# EAGLE design c64-rx (EAGLE 7.7.0)
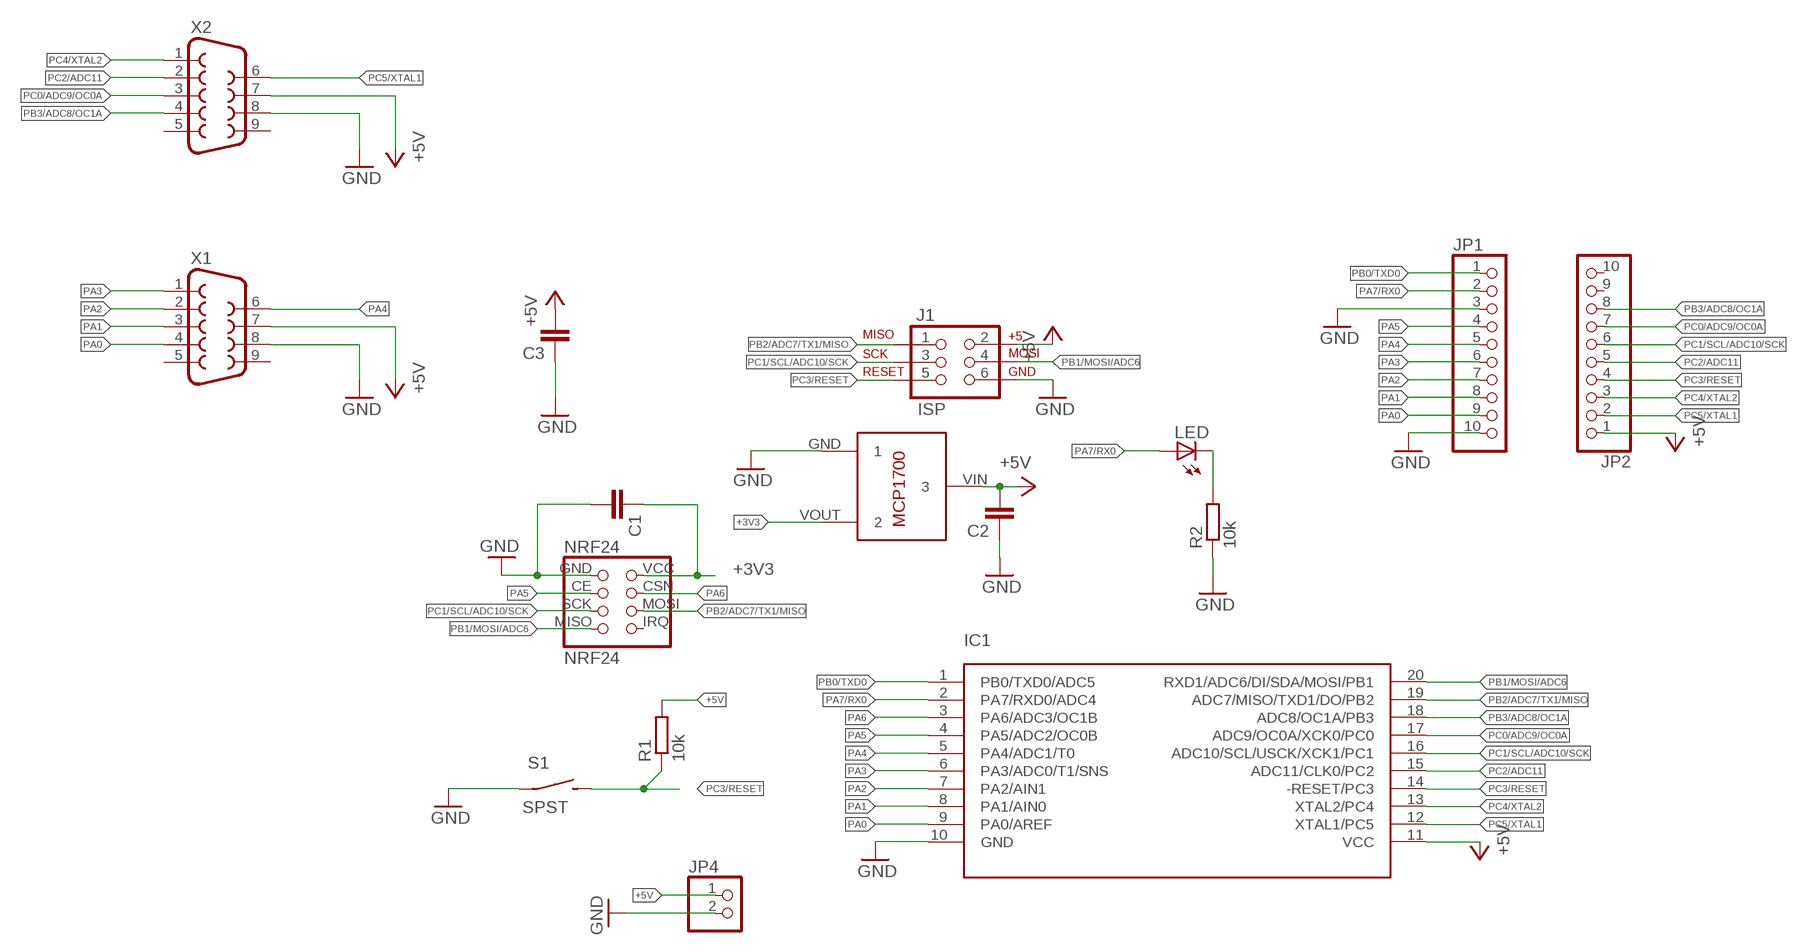
[diagram p0: schematic, sheet 1]

## Parts
C1  C-EUC1206K  [C1206K]
C2  C-EUC1206K  [C1206K]
C3  C-EUC1206K  [C1206K]
IC1  ATTINY1634  [SOIC20]
J1  ISP  AVR_SPI_PRG_6NS  [2X3-NS]
JP1  PINHD-1X10  [1X10]
JP2  PINHD-1X10  [1X10]
JP4  PINHD-1X2  [1X02]
LED  LEDSMT1206  [1206]
NRF24  NRF24  [NRF24]
R1  10k  R-EU_M1206  [M1206]
R2  10k  R-EU_M1206  [M1206]
S1  SPST  SPST_OFFBOARD_LG  [OFFBOARD_2_LG]
U$3  MCP1700T-3302E/TT  [MCP1700T-3302E/TT]
X1  F09D  [F09D]
X2  F09D  [F09D]

## Nets
+3V3 [POWER]: C1.1 NRF24.VCC U$3.VOUT
+5V [POWER]: C2.2 C3.2 IC1.11(VCC) J1.2 JP2.1 JP4.1 R1.2 U$3.VIN X1.7 X2.7
GND [POWER]: C1.2 C2.1 C3.1 IC1.10(GND) J1.6 JP1.3 JP1.10 JP4.2 NRF24.GND R2.1 S1.P$1(P) U$3.GND X1.8 X2.8
N$1: LED.C R2.2
PA0: IC1.9(PA0/AREF) JP1.9 X1.4
PA1: IC1.8(PA1/AIN0) JP1.8 X1.3
PA2: IC1.7(PA2/AIN1) JP1.7 X1.2
PA3: IC1.6(PA3/ADC0/T1/SNS) JP1.6 X1.1
PA4: IC1.5(PA4/ADC1/T0) JP1.5 X1.6
PA5: IC1.4(PA5/ADC2/OC0B) JP1.4 NRF24.CE
PA6: IC1.3(PA6/ADC3/OC1B) NRF24.CSN
PA7/RX0: IC1.2(PA7/RXD0/ADC4) JP1.2 LED.A
PB0/TXD0: IC1.1(PB0/TXD0/ADC5) JP1.1
PB1/MOSI/ADC6: IC1.20(RXD1/ADC6/DI/SDA/MOSI/PB1) J1.4 NRF24.MISO
PB2/ADC7/TX1/MISO: IC1.19(ADC7/MISO/TXD1/DO/PB2) J1.1 NRF24.MOSI
PB3/ADC8/OC1A: IC1.18(ADC8/OC1A/PB3) JP2.8 X2.4
PC0/ADC9/OC0A: IC1.17(ADC9/OC0A/XCK0/PC0) JP2.7 X2.3
PC1/SCL/ADC10/SCK: IC1.16(ADC10/SCL/USCK/XCK1/PC1) J1.3 JP2.6 NRF24.SCK
PC2/ADC11: IC1.15(ADC11/CLK0/PC2) JP2.5 X2.2
PC3/RESET: IC1.14(-RESET/PC3) J1.5 JP2.4 R1.1 S1.P$2(S)
PC4/XTAL2: IC1.13(XTAL2/PC4) JP2.3 X2.1
PC5/XTAL1: IC1.12(XTAL1/PC5) JP2.2 X2.6
Unconnected: JP2.9 JP2.10 NRF24.IRQ X1.5 X1.9 X2.5 X2.9

## Library data of the parts
C1 C2 = resistor:C-EU: CAPACITOR, European symbol
C3 = rcl:C-EU: CAPACITOR, European symbol
IC1 = attiny1634:ATTINY1634
J1 = SparkFun-Connectors:AVR_SPI_PRG_6: AVR ISP 6 Pin This is the reduced ISP connector for AVR programming. Common on Arduino. This footprint will take up less PCB space and can be used with a 10-pin to 6-pin adapter such as SKU: BOB-08508
JP1 JP2 = pinhead:PINHD-1X10: PIN HEADER
JP4 = pinhead:PINHD-1X2: PIN HEADER
LED = led:LED: LED OSRAM: - CHIPLED LG R971, LG N971, LY N971, LG Q971, LY Q971, LO R971, LY R971 LH N974, LH R974 LS Q976, LO Q976, LY Q976 LO Q996 - Hyper CHIPLED LW Q18S LB Q993, LB Q99A, LB R99A - SideLED LS A670, LO A670, LY A670, LG A670, LP A670 LB A673, LV A673, LT A673, LW A673 LH A674 LY A675 LS A676, LA A676, LO A676, LY A676, LW A676 LS A679, LY A679, LG A679 - Hyper Micro SIDELED® LS Y876, LA Y876, LO Y876, LY Y876 LT Y87S - SmartLED LW L88C, LW L88S LB L89C, LB L89S, LG L890 LS L89K, LO L89K, LY L89K LS L896, LA L896, LO L896, LY L896 - TOPLED LS T670, LO T670, LY T670, LG T670, LP T670 LSG T670, LSP T670, LSY T670, LOP T670, LYG T670 LG T671, LOG T671, LSG T671 LB T673, LV T673, LT T673, LW T673 LH T674 LS T676, LA T676, LO T676, LY T676, LB T676, LH T676, LSB T676, LW T676 LB T67C, LV T67C, LT T67C, LS T67K, LO T67K, LY T67K, LW E67C LS E67B, LA E67B, LO E67B, LY E67B, LB E67C, LV E67C, LT E67C LW T67C LS T679, LY T679, LG T679 LS T770, LO T770, LY T770, LG T770, LP T770 LB T773, LV T773, LT T773, LW T773 LH T774 LS E675, LA E675, LY E675, LS T675 LS T776, LA T776, LO T776, LY T776, LB T776 LHGB T686 LT T68C, LB T68C - Hyper Mini TOPLED® LB M676 - Mini TOPLED Santana® LG M470 LS M47K, LO M47K, LY M47K Source: http://www.osram.convergy.de LUXEON: - LUMILED® LXK2-PW12-R00, LXK2-PW12-S00, LXK2-PW14-U00, LXK2-PW14-V00 LXK2-PM12-R00, LXK2-PM12-S00, LXK2-PM14-U00 LXK2-PE12-Q00, LXK2-PE12-R00, LXK2-PE12-S00, LXK2-PE14-T00, LXK2-PE14-U00 LXK2-PB12-K00, LXK2-PB12-L00, LXK2-PB12-M00, LXK2-PB14-N00, LXK2-PB14-P00, LXK2-PB14-Q00 LXK2-PR12-L00, LXK2-PR12-M00, LXK2-PR14-Q00, LXK2-PR14-R00 LXK2-PD12-Q00, LXK2-PD12-R00, LXK2-PD12-S00 LXK2-PH12-R00, LXK2-PH12-S00 LXK2-PL12-P00, LXK2-PL12-Q00, LXK2-PL12-R00 Source: www.luxeon.com KINGBRIGHT: KA-3528ASYC Source: www.kingbright.com
NRF24 = mine:NRF24
R1 R2 = rcl:R-EU_: RESISTOR, European symbol
S1 = bt_electromech:SPST: SPST SWITCH
U$3 = MCP1700T-3302E_TT:MCP1700T-3302E/TT: Microchip LDO "MCP1700" in a 3-Pin SOT-23 package. ID: MCP1700T-3302E/TT
X1 X2 = con-subd:F09: SUB-D; OC_FARNELL: unknown; OC_NEWARK: unknown

## Net classes
1 POWER: width 0.254 mm

## Board
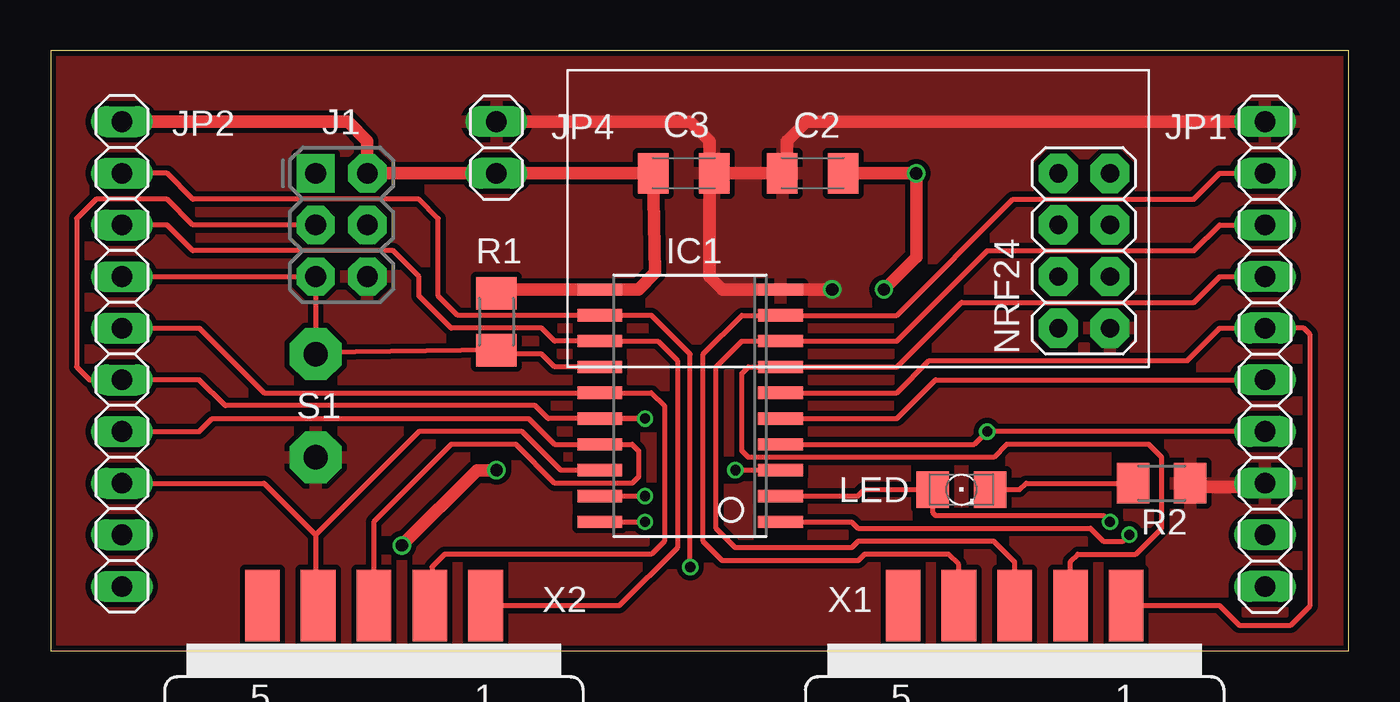
[diagram p1: board, top side]
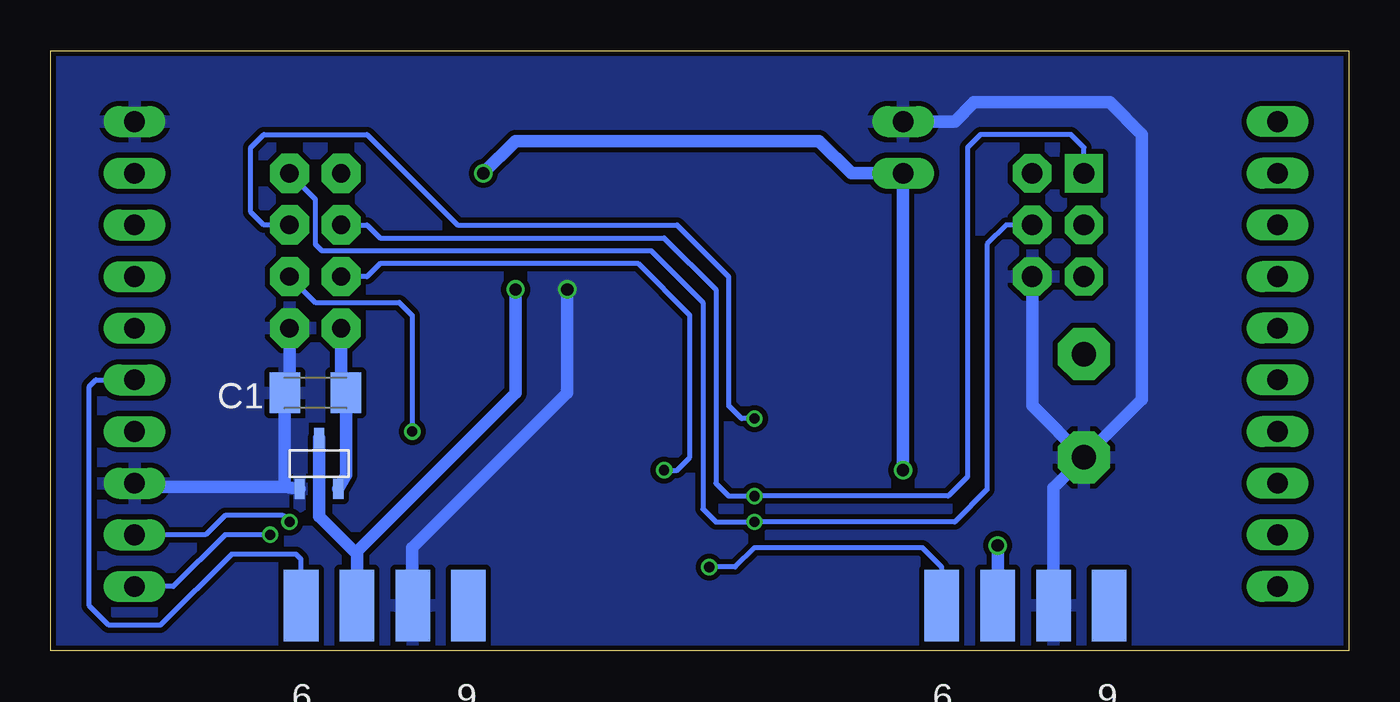
[diagram p2: board, bottom side, seen from below]

Size 63.8 x 29.52 mm. Coordinates in mm from the lower left corner, seen from the top.
Outline: 0,0 63.8,0 63.8,29.52 0,29.52 0,0
Copper layers (1*16): Top 0.035mm / dielectric 1.5mm / Bottom 0.035mm
Design rules "dirt_cheap_dirty_boards.v1": minimum track width 5mil, minimum drill 12mil, track to track 5mil, track to pad 5mil, pad to pad 5mil, via to via 5mil, smd to smd 0mil, copper to edge 10mil, drill to drill 10mil, minimum pad ring 10mil, minimum via ring 6mil, stop-mask expansion 2mil, vias tented up to drill 25mil, thermal gap 10mil

### Footprints (pad centres in the part's own frame; a part is rotated, then mirrored left to right if it is on the bottom)
C1206K = smd 1.5 x 2: 1 -1.5,0; 2 1.5,0
SOIC20 = smd 0.6 x 2.2: 1 -1.905,-4.445; 2 -0.635,-4.445; 3 0.635,-4.445; 4 1.905,-4.445; 5 3.175,-4.445; 6 4.445,-4.445; 7 5.715,-4.445; 8 6.985,-4.445; 9 8.255,-4.445; 10 9.525,-4.445; 11 9.525,4.445; 12 8.255,4.445; 13 6.985,4.445; 14 5.715,4.445; 15 4.445,4.445; 16 3.175,4.445; 17 1.905,4.445; 18 0.635,4.445; 19 -0.635,4.445; 20 -1.905,4.445
2X3-NS = drill 1.016 pad 1.88 square: 1 -2.54,-1.27 | drill 1.016 pad 1.88 octagon: 2 -2.54,1.27; 3 0,-1.27; 4 0,1.27; 5 2.54,-1.27; 6 2.54,1.27
1X10 = drill 1.016 long: 1 -11.43,0; 2 -8.89,0; 3 -6.35,0; 4 -3.81,0; 5 -1.27,0; 6 1.27,0; 7 3.81,0; 8 6.35,0; 9 8.89,0; 10 11.43,0
1X02 = drill 1.016 long: 1 -1.27,0; 2 1.27,0
1206 = smd 1.6 x 1.803: A -1.422,0; C 1.422,0
NRF24 = drill 0.9 pad 1.93 octagon: CE 3.81,-1.27; CSN 3.81,1.27; GND 1.27,-1.27; IRQ 8.89,1.27; MISO 8.89,-1.27; MOSI 6.35,1.27; SCK 6.35,-1.27; VCC 1.27,1.27
M1206 = smd 1.6 x 2: 1 -1.4,0; 2 1.4,0
OFFBOARD_2_LG = drill 1.2 pad 2.54 octagon: P$1 -2.54,0; P$2 2.54,0
MCP1700T-3302E/TT = smd 0.5 x 1: GND 0.5,-0.6; VIN 1.45,1.9; VOUT 2.4,-0.6
F09D = smd 1.7 x 3.5: 1 -5.486,-6.045; 2 -2.743,-6.045; 3 0,-6.045; 4 2.743,-6.045; 5 5.486,-6.045 | smd 1.7 x 3.5 bottom: 6 -4.115,-6.045; 7 -1.372,-6.045; 8 1.372,-6.045; 9 4.115,-6.045

### Placement (x,y rotation side)
C1  50.8,12.7 180 bottom
C2  37.47,23.5 0 top
C3  31.11,23.5 180 top
IC1  31.43,8.26 90 top
J1  14.29,20.95 270 top
JP1  59.69,14.61 90 top
JP2  3.49,14.61 270 top
JP4  21.91,24.77 90 top
LED  44.77,7.94 0 top
NRF24  50.8,14.61 90 top
R1  21.91,16.19 90 top
R2  54.61,8.26 180 top
S1  13.02,12.06 90 top
U$3  52.07,8.57 0 bottom
X1  47.38,-3.81 180 top
X2  15.88,-3.81 180 top

### Tracks (layer width: path | path; a pad name or v marks a point on that pad's centre or on a via)
+3V3
  Bottom 0.61: NRF24.VCC 49.53,12.93 C1.1 49.3,8.66 U$3.VOUT
+5V  (via drill 0.6)
  Top 0.61: JP2.1 14.61,26.04 15.56,25.08 J1.2 JP4.1 C3.2 29.71,18.6 28.89,17.78 IC1.11 22,17.78 R1.2 | v17.26,5.19 20.95,8.89 v21.91,8.89 | C2.2 v42.55,23.5 42.55,19.37 v40.96,17.78
  Bottom 0.61: X2.7 v17.26,5.19 | v21.91,8.89 JP4.1 24.45,23.5 26.04,25.08 40.96,25.08 v42.55,23.5 | X1.7 48.76,4.76 | 48.76,4.76 48.76,4.9 40.96,12.7 v40.96,17.78 | U$3.VIN 50.62,6.63 48.76,4.76
GND  (via drill 0.6)
  Top 0.61: JP4.2 31.43,26.04 32.38,25.08 32.38,23.62 C3.1 | C3.1 32.38,23.36 32.38,18.41 33.02,17.78 IC1.10 v38.42,17.78 | C3.1 C2.1 36.2,23.73 36.2,25.08 37.15,26.04 JP1.10 | R2.1 56.2,8.07 59.5,8.07 JP1.3
  Bottom 0.254: 46.04,2.26 X1.8
  Bottom 0.61: X2.8 14.51,8.03 S1.P$1 | J1.6 15.56,12.06 S1.P$1 | JP4.2 19.37,26.04 18.41,26.99 11.75,26.99 10.16,25.4 10.16,12.38 S1.P$1 | v38.42,17.78 38.42,12.7 46.04,5.08 46.04,2.26 | NRF24.GND 52.07,12.93 C1.2 52.3,8.07 | 52.3,8.07 U$3.GND | 52.3,8.07 59.5,8.07 JP1.3
  pour Bottom (isolate 0.254): 0,29.53 63.82,29.53 63.82,0 0,0
  pour Top (isolate 0.254): 0,29.53 63.82,29.53 63.82,0 0,0
N$1
  Top 0.254: LED.C 47.62,7.94 47.94,8.26 R2.2
PA0
  Top 0.254: JP1.9 57.47,23.5 56.2,22.23 47.31,22.23 41.59,16.51 IC1.9 33.97,16.51 32.07,14.61 32.07,5.4 33.02,4.45 39.69,4.45 40.01,4.76 44.13,4.76 44.64,4.25 X1.4
PA1
  Top 0.254: JP1.8 57.47,20.95 56.2,19.68 46.04,19.68 41.59,15.24 IC1.8 33.97,15.24 32.7,13.97 32.7,6.03 33.66,5.08 39.37,5.08 39.69,5.4 46.35,5.4 47.38,4.37 X1.3
PA2
  Top 0.254: JP1.7 57.47,18.41 56.2,17.14 44.77,17.14 41.59,13.97 IC1.7 34.29,13.97 33.97,13.65 33.97,9.84 34.29,9.53 46.35,9.53 46.99,10.16 53.98,10.16 54.61,9.53 54.61,6.03 53.34,4.76 50.48,4.76 50.13,4.41 X1.2
PA3
  Top 0.254: IC1.6 41.59,12.7 43.18,14.29 55.88,14.29 57.47,15.88 JP1.6 61.59,15.88 61.91,15.56 61.91,2.22 60.96,1.27 58.42,1.27 57.45,2.23 X1.1
PA4
  Top 0.254: IC1.5 41.59,11.43 43.5,13.34 JP1.5
  Bottom 0.254: X1.6 51.5,4.51 51.75,4.76 54.93,4.76 58.42,1.27 60.96,1.27 61.91,2.22 61.91,13.02 61.59,13.34 JP1.5
PA5  (via drill 0.5)
  Top 0.254: IC1.4 45.4,10.16 v46.04,10.79 JP1.4
  Bottom 0.254: NRF24.CE 50.8,17.14 46.67,17.14 46.04,16.51 v46.04,10.79
PA6  (via drill 0.5)
  Top 0.254: IC1.3 v33.66,8.89
  Bottom 0.254: v33.66,8.89 33.02,8.89 32.38,9.53 32.38,16.51 34.92,19.05 47.62,19.05 48.26,18.41 NRF24.CSN
PA7/RX0  (via drill 0.5)
  Top 0.254: IC1.2 39.69,7.62 40.01,7.94 LED.A 43.35,6.82 43.5,6.67 51.75,6.67 v52.07,6.35
  Bottom 0.254: v52.07,6.35 52.39,6.67 55.24,6.67 56.2,5.71 JP1.2
PB0/TXD0  (via drill 0.5)
  Top 0.254: IC1.1 39.37,6.35 39.69,6.03 51.12,6.03 51.75,5.4 52.7,5.4 v53.02,5.71
  Bottom 0.254: v53.02,5.71 55.24,5.71 57.78,3.17 JP1.1
PB1/MOSI/ADC6  (via drill 0.5)
  Top 0.254: IC1.20 v29.21,6.35
  Bottom 0.254: NRF24.MISO 50.8,22.23 50.8,20 50.48,19.68 34.29,19.68 31.75,17.14 31.75,6.99 31.11,6.35 v29.21,6.35 19.37,6.35 17.78,7.94 17.78,20 16.83,20.95 J1.4
PB2/ADC7/TX1/MISO  (via drill 0.5)
  Top 0.254: IC1.19 v29.21,7.62
  Bottom 0.254: NRF24.MOSI 48.26,20.95 47.62,20.32 33.66,20.32 31.11,17.78 31.11,8.26 30.48,7.62 v29.21,7.62 19.68,7.62 18.73,8.57 18.73,24.77 18.1,25.4 13.65,25.4 13.02,24.77 J1.1
PB3/ADC8/OC1A
  Top 0.254: IC1.18 25.08,8.89 23.18,10.79 18.1,10.79 13.02,5.71 | 13.02,5.71 13.02,2.36 X2.4 | JP2.8 10.48,8.26 13.02,5.71
PC0/ADC9/OC0A
  Top 0.254: X2.3 15.88,2.25 15.88,6.35 19.68,10.16 22.86,10.16 24.77,8.26 28.57,8.26 28.89,8.57 28.89,9.84 28.57,10.16 IC1.17 24.77,10.16 23.5,11.43 7.94,11.43 7.3,10.79 JP2.7
PC1/SCL/ADC10/SCK  (via drill 0.5)
  Top 0.254: IC1.16 v29.21,11.43 24.45,11.43 23.81,12.06 8.57,12.06 7.3,13.34 JP2.6 1.91,13.34 1.27,13.97 1.27,21.27 2.22,22.23 5.71,22.23 6.99,20.95 J1.3
  Bottom 0.254: v29.21,11.43 29.84,11.43 30.48,12.06 30.48,18.41 33.02,20.95 43.81,20.95 48.26,25.4 53.34,25.4 53.98,24.77 53.98,21.59 53.34,20.95 NRF24.SCK
PC2/ADC11
  Top 0.254: X2.2 18.73,2.34 18.73,4.13 19.37,4.76 29.53,4.76 30.16,5.4 30.16,12.06 29.53,12.7 IC1.15 10.48,12.7 7.3,15.88 JP2.5
PC3/RESET
  Top 0.254: IC1.14 24.77,13.97 24.13,14.61 22,14.61 R1.1 13.25,14.69 S1.P$2 J1.5 JP2.4
PC4/XTAL2
  Top 0.254: JP2.3 5.71,20.95 6.99,19.68 16.83,19.68 18.1,18.41 18.1,17.46 19.68,15.88 24.13,15.88 24.77,15.24 IC1.13 29.84,15.24 30.8,14.29 30.8,5.08 27.94,2.22 21.38,2.22 X2.1
PC5/XTAL1  (via drill 0.5)
  Top 0.254: JP2.2 5.71,23.5 6.99,22.23 18.1,22.23 19.05,21.27 19.05,17.46 20,16.51 IC1.12 29.53,16.51 31.43,14.61 v31.43,4.13
  Bottom 0.254: X2.6 20,4.12 20.95,5.08 29.21,5.08 30.16,4.13 v31.43,4.13